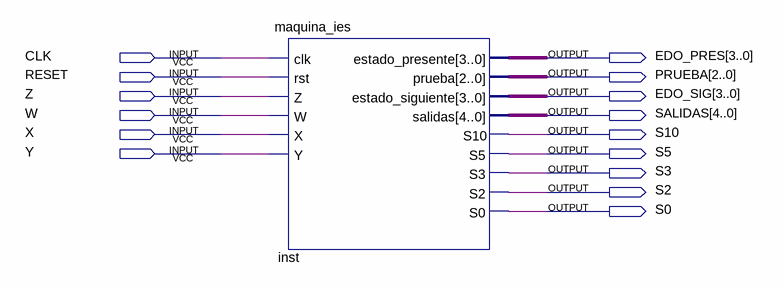
[diagram p0: schematic sheet]
// Quartus schematic Practica_04.bdf as structural Verilog: 1 symbols, 15 pins
module Practica_04 (
  input  CLK,
  input  RESET,
  input  Z,
  input  W,
  input  X,
  input  Y,
  output [3:0] EDO_PRES,
  output [2:0] PRUEBA,
  output [3:0] EDO_SIG,
  output [4:0] SALIDAS,
  output S10,
  output S5,
  output S3,
  output S2,
  output S0
);

  maquina_ies inst (
    .clk(CLK), .rst(RESET), .Z(Z), .W(W), .X(X), .Y(Y), .estado_presente(EDO_PRES), .prueba(PRUEBA),
    .estado_siguiente(EDO_SIG), .salidas(SALIDAS), .S10(S10), .S5(S5), .S3(S3), .S2(S2), .S0(S0));
endmodule
